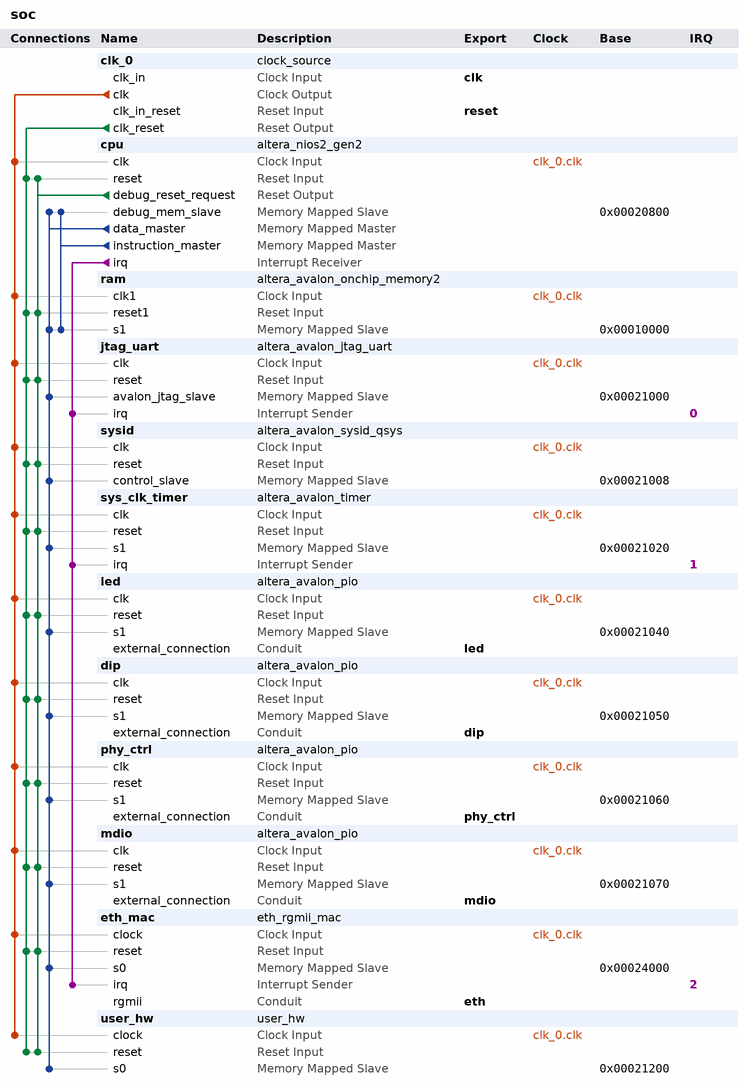
[diagram p0: system contents]
# Platform Designer (Qsys) system soc, Cyclone 10 LP 10CL025YU256I7G
# Parameters at their usual value, and those the tool derives, are not listed.
package require -exact qsys 17.1
create_system soc
set_project_property DEVICE_FAMILY {Cyclone 10 LP}
set_project_property DEVICE 10CL025YU256I7G

add_instance clk_0 clock_source 17.1
set_instance_parameter_value clk_0 clockFrequency 50000000
set_instance_parameter_value clk_0 resetSynchronousEdges DEASSERT

add_instance cpu altera_nios2_gen2 17.1
set_instance_parameter_value cpu dcache_size 2048
set_instance_parameter_value cpu exceptionSlave ram.s1
set_instance_parameter_value cpu icache_size 4096
set_instance_parameter_value cpu impl Tiny
set_instance_parameter_value cpu resetSlave ram.s1

add_instance ram altera_avalon_onchip_memory2 17.1
set_instance_parameter_value ram dataWidth 32
set_instance_parameter_value ram dualPort false
set_instance_parameter_value ram initMemContent true
set_instance_parameter_value ram initializationFileName onchip_mem.hex
set_instance_parameter_value ram memorySize 45056

add_instance jtag_uart altera_avalon_jtag_uart 17.1
set_instance_parameter_value jtag_uart simInteractiveOptions NO_INTERACTIVE_WINDOWS

add_instance sysid altera_avalon_sysid_qsys 17.1
set_instance_parameter_value sysid id 281673729

add_instance sys_clk_timer altera_avalon_timer 17.1
set_instance_parameter_value sys_clk_timer period 1
set_instance_parameter_value sys_clk_timer periodUnits MSEC

add_instance led altera_avalon_pio 17.1
set_instance_parameter_value led direction Output
set_instance_parameter_value led resetValue 15
set_instance_parameter_value led width 4

add_instance dip altera_avalon_pio 17.1
set_instance_parameter_value dip direction Input
set_instance_parameter_value dip width 3

add_instance phy_ctrl altera_avalon_pio 17.1
set_instance_parameter_value phy_ctrl direction Output
set_instance_parameter_value phy_ctrl width 2

add_instance mdio altera_avalon_pio 17.1
set_instance_parameter_value mdio direction Bidir
set_instance_parameter_value mdio width 1

add_instance eth_mac eth_rgmii_mac 1.0

add_instance user_hw user_hw 1.0

# connections
add_connection clk_0.clk cpu.clk clock
add_connection clk_0.clk dip.clk clock
add_connection clk_0.clk eth_mac.clock clock
add_connection clk_0.clk jtag_uart.clk clock
add_connection clk_0.clk led.clk clock
add_connection clk_0.clk mdio.clk clock
add_connection clk_0.clk phy_ctrl.clk clock
add_connection clk_0.clk ram.clk1 clock
add_connection clk_0.clk sys_clk_timer.clk clock
add_connection clk_0.clk sysid.clk clock
add_connection clk_0.clk user_hw.clock clock
add_connection clk_0.clk_reset cpu.reset reset
add_connection clk_0.clk_reset dip.reset reset
add_connection clk_0.clk_reset eth_mac.reset reset
add_connection clk_0.clk_reset jtag_uart.reset reset
add_connection clk_0.clk_reset led.reset reset
add_connection clk_0.clk_reset mdio.reset reset
add_connection clk_0.clk_reset phy_ctrl.reset reset
add_connection clk_0.clk_reset ram.reset1 reset
add_connection clk_0.clk_reset sys_clk_timer.reset reset
add_connection clk_0.clk_reset sysid.reset reset
add_connection clk_0.clk_reset user_hw.reset reset
add_connection cpu.debug_reset_request cpu.reset reset
add_connection cpu.debug_reset_request dip.reset reset
add_connection cpu.debug_reset_request eth_mac.reset reset
add_connection cpu.debug_reset_request jtag_uart.reset reset
add_connection cpu.debug_reset_request led.reset reset
add_connection cpu.debug_reset_request mdio.reset reset
add_connection cpu.debug_reset_request phy_ctrl.reset reset
add_connection cpu.debug_reset_request ram.reset1 reset
add_connection cpu.debug_reset_request sys_clk_timer.reset reset
add_connection cpu.debug_reset_request sysid.reset reset
add_connection cpu.debug_reset_request user_hw.reset reset
add_connection cpu.data_master cpu.debug_mem_slave avalon
set_connection_parameter_value cpu.data_master/cpu.debug_mem_slave baseAddress 0x00020800
add_connection cpu.data_master dip.s1 avalon
set_connection_parameter_value cpu.data_master/dip.s1 baseAddress 0x00021050
add_connection cpu.data_master eth_mac.s0 avalon
set_connection_parameter_value cpu.data_master/eth_mac.s0 baseAddress 0x00024000
add_connection cpu.data_master jtag_uart.avalon_jtag_slave avalon
set_connection_parameter_value cpu.data_master/jtag_uart.avalon_jtag_slave baseAddress 0x00021000
add_connection cpu.data_master led.s1 avalon
set_connection_parameter_value cpu.data_master/led.s1 baseAddress 0x00021040
add_connection cpu.data_master mdio.s1 avalon
set_connection_parameter_value cpu.data_master/mdio.s1 baseAddress 0x00021070
add_connection cpu.data_master phy_ctrl.s1 avalon
set_connection_parameter_value cpu.data_master/phy_ctrl.s1 baseAddress 0x00021060
add_connection cpu.data_master ram.s1 avalon
set_connection_parameter_value cpu.data_master/ram.s1 baseAddress 0x00010000
add_connection cpu.data_master sys_clk_timer.s1 avalon
set_connection_parameter_value cpu.data_master/sys_clk_timer.s1 baseAddress 0x00021020
add_connection cpu.data_master sysid.control_slave avalon
set_connection_parameter_value cpu.data_master/sysid.control_slave baseAddress 0x00021008
add_connection cpu.data_master user_hw.s0 avalon
set_connection_parameter_value cpu.data_master/user_hw.s0 baseAddress 0x00021200
add_connection cpu.instruction_master cpu.debug_mem_slave avalon
set_connection_parameter_value cpu.instruction_master/cpu.debug_mem_slave baseAddress 0x00020800
add_connection cpu.instruction_master ram.s1 avalon
set_connection_parameter_value cpu.instruction_master/ram.s1 baseAddress 0x00010000
add_connection cpu.irq eth_mac.irq interrupt
set_connection_parameter_value cpu.irq/eth_mac.irq irqNumber 2
add_connection cpu.irq jtag_uart.irq interrupt
set_connection_parameter_value cpu.irq/jtag_uart.irq irqNumber 0
add_connection cpu.irq sys_clk_timer.irq interrupt
set_connection_parameter_value cpu.irq/sys_clk_timer.irq irqNumber 1

# exported interfaces
add_interface clk clock sink
set_interface_property clk EXPORT_OF clk_0.clk_in
add_interface dip conduit end
set_interface_property dip EXPORT_OF dip.external_connection
add_interface eth conduit end
set_interface_property eth EXPORT_OF eth_mac.rgmii
add_interface led conduit end
set_interface_property led EXPORT_OF led.external_connection
add_interface mdio conduit end
set_interface_property mdio EXPORT_OF mdio.external_connection
add_interface phy_ctrl conduit end
set_interface_property phy_ctrl EXPORT_OF phy_ctrl.external_connection
add_interface reset reset sink
set_interface_property reset EXPORT_OF clk_0.clk_in_reset

set_interconnect_requirement {$system} qsys_mm.clockCrossingAdapter HANDSHAKE
set_interconnect_requirement {$system} qsys_mm.enableEccProtection FALSE
set_interconnect_requirement {$system} qsys_mm.insertDefaultSlave FALSE
set_interconnect_requirement {$system} qsys_mm.maxAdditionalLatency 1

save_system soc.qsys
